# Altium schematic sheet 29_Radar_rail_selection_and_sensing.SchDoc
size 289 x 396 mm
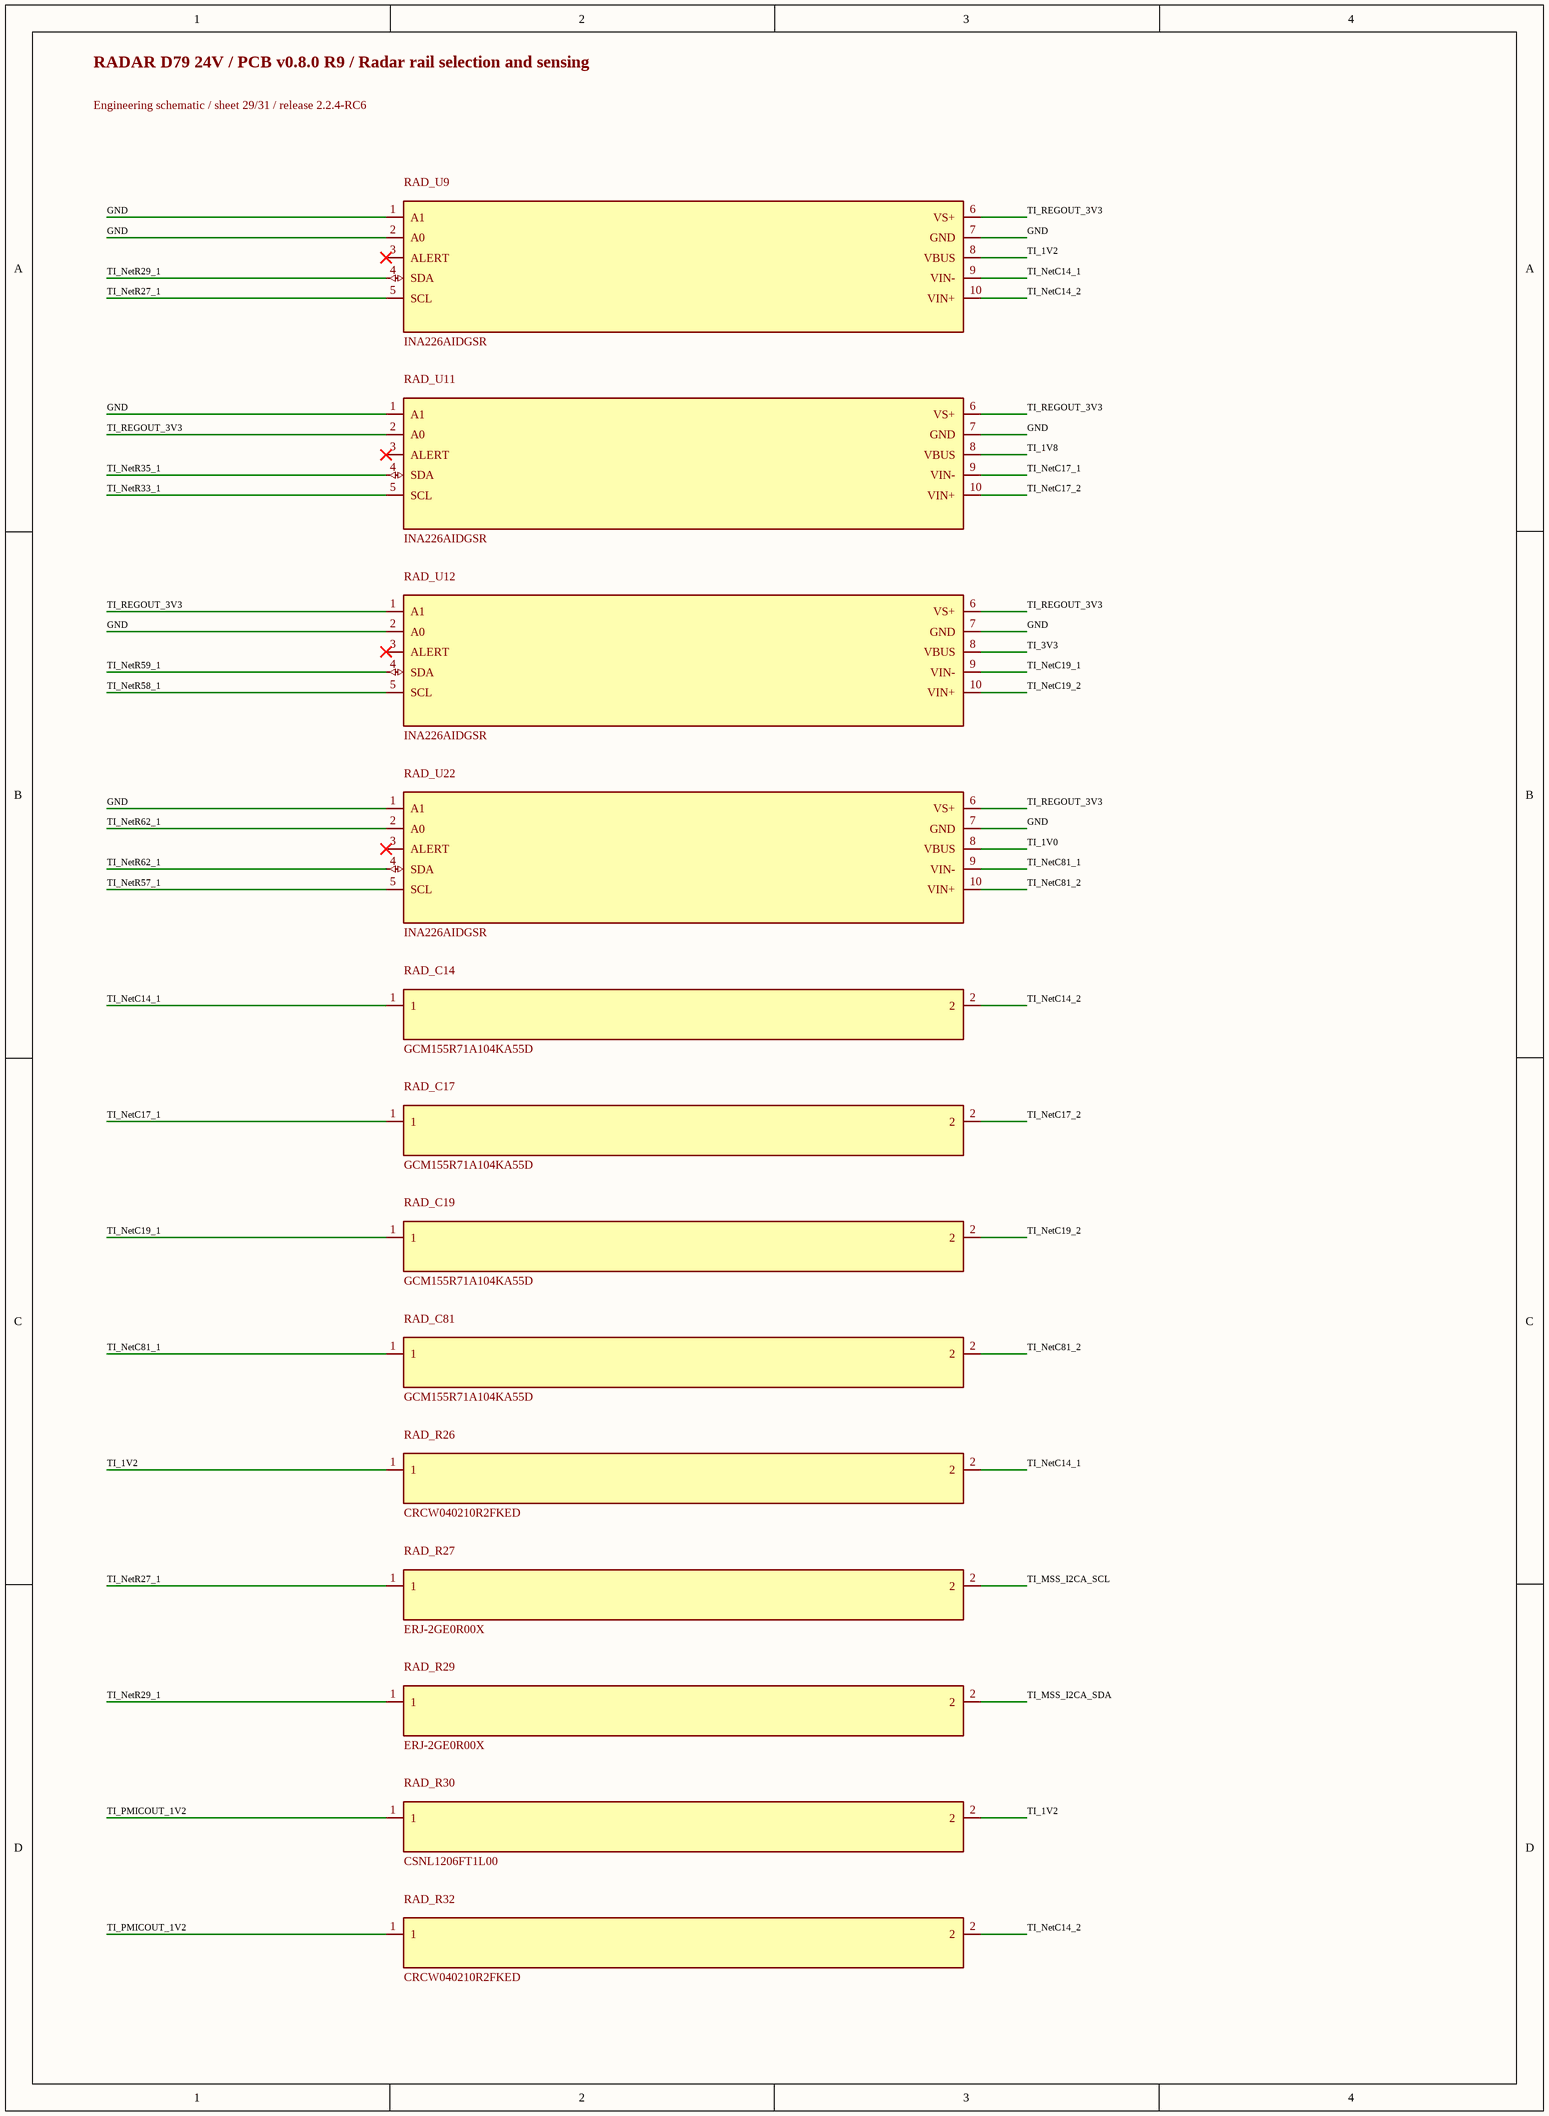
[diagram p0: 29_Radar_rail_selection_and_sensing.SchDoc]

## Parts
RAD_C14  GCM155R71A104KA55D  [0402L]
RAD_C17  GCM155R71A104KA55D  [0402L]
RAD_C19  GCM155R71A104KA55D  [0402L]
RAD_C81  GCM155R71A104KA55D  [0402L]
RAD_R26  CRCW040210R2FKED  [0402L]
RAD_R27  ERJ-2GE0R00X  [0402L]
RAD_R29  ERJ-2GE0R00X  [0402L]
RAD_R30  CSNL1206FT1L00  [1206L]
RAD_R32  CRCW040210R2FKED  [0402L]
RAD_U9  INA226AIDGSR  [DGS0010A_L]
RAD_U11  INA226AIDGSR  [DGS0010A_L]
RAD_U12  INA226AIDGSR  [DGS0010A_L]
RAD_U22  INA226AIDGSR  [DGS0010A_L]

## Nets
GND: RAD_U9.1(A1) RAD_U9.2(A0) RAD_U9.7(GND) RAD_U11.1(A1) RAD_U11.7(GND) RAD_U12.2(A0) RAD_U12.7(GND) RAD_U22.1(A1) RAD_U22.7(GND)
TI_1V0: RAD_U22.8(VBUS)
TI_1V2: RAD_R26.1 RAD_R30.2 RAD_U9.8(VBUS)
TI_1V8: RAD_U11.8(VBUS)
TI_3V3: RAD_U12.8(VBUS)
TI_MSS_I2CA_SCL: RAD_R27.2
TI_MSS_I2CA_SDA: RAD_R29.2
TI_NetC14_1: RAD_C14.1 RAD_R26.2 RAD_U9.9(VIN-)
TI_NetC14_2: RAD_C14.2 RAD_R32.2 RAD_U9.10(VIN+)
TI_NetC17_1: RAD_C17.1 RAD_U11.9(VIN-)
TI_NetC17_2: RAD_C17.2 RAD_U11.10(VIN+)
TI_NetC19_1: RAD_C19.1 RAD_U12.9(VIN-)
TI_NetC19_2: RAD_C19.2 RAD_U12.10(VIN+)
TI_NetC81_1: RAD_C81.1 RAD_U22.9(VIN-)
TI_NetC81_2: RAD_C81.2 RAD_U22.10(VIN+)
TI_NetR27_1: RAD_R27.1 RAD_U9.5(SCL)
TI_NetR29_1: RAD_R29.1 RAD_U9.4(SDA)
TI_NetR33_1: RAD_U11.5(SCL)
TI_NetR35_1: RAD_U11.4(SDA)
TI_NetR57_1: RAD_U22.5(SCL)
TI_NetR58_1: RAD_U12.5(SCL)
TI_NetR59_1: RAD_U12.4(SDA)
TI_NetR62_1: RAD_U22.2(A0) RAD_U22.4(SDA)
TI_PMICOUT_1V2: RAD_R30.1 RAD_R32.1
TI_REGOUT_3V3: RAD_U9.6(VS+) RAD_U11.2(A0) RAD_U11.6(VS+) RAD_U12.1(A1) RAD_U12.6(VS+) RAD_U22.6(VS+)

Not connected (* = marked no-connect by the designer): RAD_U9 3(ALERT)*; RAD_U11 3(ALERT)*; RAD_U12 3(ALERT)*; RAD_U22 3(ALERT)*

## Notes on the sheet
- RADAR D79 24V / PCB v0.8.0 R9 / Radar rail selection and sensing
- Engineering schematic / sheet 29/31 / release 2.2.4-RC6